# Altium schematic sheet Top-Sheet.SchDoc
size A4; SheetNumber: 1; SheetTotal: 7
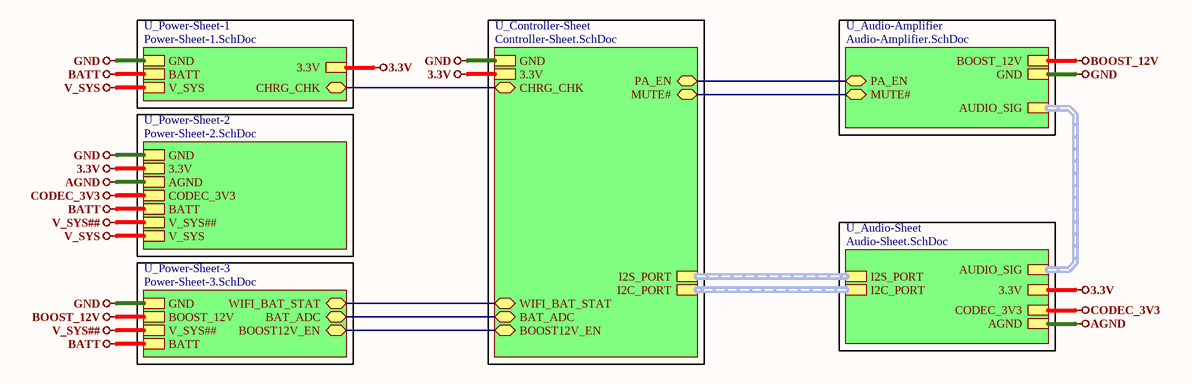
[diagram p0: Top-Sheet.SchDoc]

## Sub-sheets
U_Audio-Amplifier = Audio-Amplifier.SchDoc: PA_EN (bidir), AUDIO_SIG (harness AUDIO_SIG), GND, BOOST_12V, MUTE# (bidir)
U_Audio-Sheet = Audio-Sheet.SchDoc: 3.3V, I2S_PORT (harness I2S_PORT), I2C_PORT (harness I2C_PORT), AGND, CODEC_3V3, AUDIO_SIG (harness AUDIO_SIG)
U_Controller-Sheet = Controller-Sheet.SchDoc: I2S_PORT (harness I2S_PORT), CHRG_CHK (bidir), BOOST12V_EN (bidir), GND, 3.3V, I2C_PORT (harness I2C_PORT), PA_EN (bidir), MUTE# (bidir), WIFI_BAT_STAT (bidir), BAT_ADC (bidir)
U_Power-Sheet-1 = Power-Sheet-1.SchDoc: GND, CHRG_CHK (bidir), BATT, V_SYS, 3.3V
U_Power-Sheet-2 = Power-Sheet-2.SchDoc: GND, 3.3V, AGND, CODEC_3V3, BATT, V_SYS##, V_SYS
U_Power-Sheet-3 = Power-Sheet-3.SchDoc: GND, BOOST_12V, BOOST12V_EN (bidir), V_SYS##, WIFI_BAT_STAT (bidir), BAT_ADC (bidir), BATT

## Nets
3.3V: sheet U_Audio-Sheet/3.3V, sheet U_Controller-Sheet/3.3V, sheet U_Power-Sheet-2/3.3V, sheet U_Power-Sheet-1/3.3V
AGND: sheet U_Audio-Sheet/AGND, sheet U_Power-Sheet-2/AGND
BATT: sheet U_Power-Sheet-2/BATT, sheet U_Power-Sheet-3/BATT, sheet U_Power-Sheet-1/BATT
BOOST_12V: sheet U_Audio-Amplifier/BOOST_12V, sheet U_Power-Sheet-3/BOOST_12V
CODEC_3V3: sheet U_Audio-Sheet/CODEC_3V3, sheet U_Power-Sheet-2/CODEC_3V3
GND: sheet U_Audio-Amplifier/GND, sheet U_Controller-Sheet/GND, sheet U_Power-Sheet-2/GND, sheet U_Power-Sheet-3/GND, sheet U_Power-Sheet-1/GND
V_SYS: sheet U_Power-Sheet-2/V_SYS, sheet U_Power-Sheet-1/V_SYS
V_SYS##: sheet U_Power-Sheet-2/V_SYS##, sheet U_Power-Sheet-3/V_SYS##
(unnamed): sheet U_Audio-Amplifier/PA_EN, sheet U_Controller-Sheet/PA_EN
(unnamed): sheet U_Audio-Amplifier/MUTE#, sheet U_Controller-Sheet/MUTE#
(unnamed): sheet U_Controller-Sheet/CHRG_CHK, sheet U_Power-Sheet-1/CHRG_CHK
(unnamed): sheet U_Controller-Sheet/BOOST12V_EN, sheet U_Power-Sheet-3/BOOST12V_EN
(unnamed): sheet U_Controller-Sheet/WIFI_BAT_STAT, sheet U_Power-Sheet-3/WIFI_BAT_STAT
(unnamed): sheet U_Controller-Sheet/BAT_ADC, sheet U_Power-Sheet-3/BAT_ADC

## Buses and harness runs
harness sheet U_Audio-Amplifier/AUDIO_SIG = sheet U_Audio-Sheet/AUDIO_SIG
harness sheet U_Audio-Sheet/I2C_PORT = sheet U_Controller-Sheet/I2C_PORT
harness sheet U_Audio-Sheet/I2S_PORT = sheet U_Controller-Sheet/I2S_PORT

## Notes on the sheet
- File:
- Title:
- Date:
- Page
- Num:
- Total:
- Drawn By: Huzaifa Ali